# EAGLE schematic Dragon-Lamp (EAGLE 9.6.2)
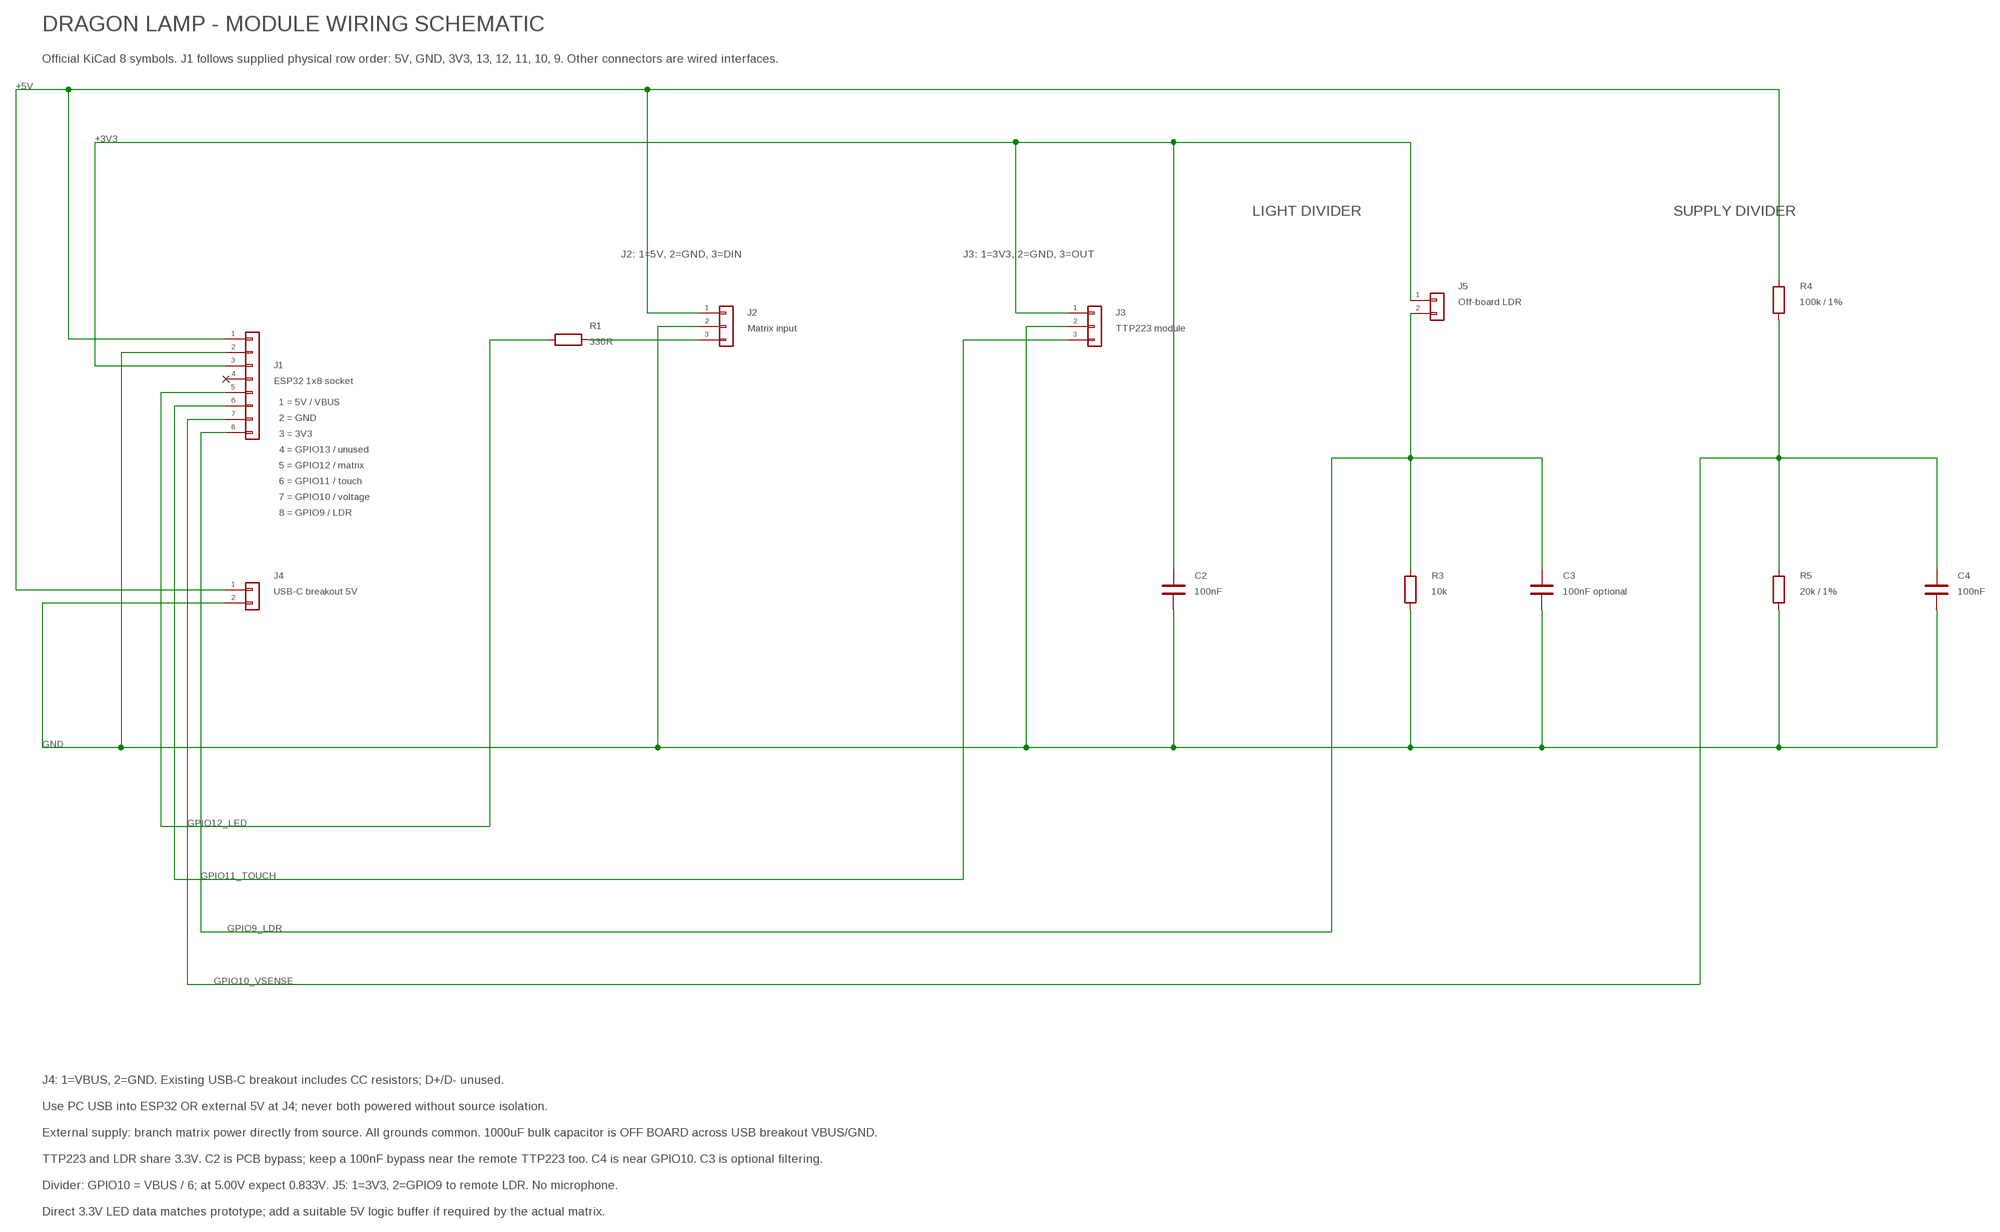
[diagram p0: schematic, sheet 1]

## Parts
C2  100nF  Device_C-THT  [C_DISC_P5.00]
C3  100nF optional  Device_C-THT  [C_DISC_P5.00]
C4  100nF  Device_C-THT  [C_DISC_P5.00]
J1  ESP32 1x8 socket  Connector_Generic_Conn_01x08-THT  [HEADER_1X8_P2.54]
J2  Matrix input  Connector_Generic_Conn_01x03-THT  [HEADER_1X3_P2.54]
J3  TTP223 module  Connector_Generic_Conn_01x03-THT  [HEADER_1X3_P2.54]
J4  USB-C breakout 5V  Connector_Generic_Conn_01x02-THT  [HEADER_1X2_P2.54]
J5  Off-board LDR  Connector_Generic_Conn_01x02-THT  [HEADER_1X2_P2.54]
R1  330R  Device_R-THT  [R_VERTICAL_P2.54]
R3  10k  Device_R-THT  [R_VERTICAL_P2.54]
R4  100k / 1%  Device_R-THT  [R_VERTICAL_P2.54]
R5  20k / 1%  Device_R-THT  [R_VERTICAL_P2.54]

## Nets
+3V3: C2.1 J1.3 J3.1 J5.1
+5V: J1.1 J2.1 J4.1 R4.1
GND: C2.2 C3.2 C4.2 J1.2 J2.2 J3.2 J4.2 R3.2 R5.2
GPIO9_LDR: C3.1 J1.8 J5.2 R3.1
GPIO10_VSENSE: C4.1 J1.7 R4.2 R5.1
GPIO11_TOUCH: J1.6 J3.3
GPIO12_LED: J1.5 R1.2
LED_DIN: J2.3 R1.1
Unconnected: J1.4

## Notes on the sheet
- DRAGON LAMP - MODULE WIRING SCHEMATIC
- Official KiCad 8 symbols. J1 follows supplied physical row order: 5V, GND, 3V3, 13, 12, 11, 10, 9. Other connectors are wired interfaces.
- LIGHT DIVIDER | SUPPLY DIVIDER
- J2: 1=5V, 2=GND, 3=DIN | J3: 1=3V3, 2=GND, 3=OUT
- 1 = 5V / VBUS
- 2 = GND
- 3 = 3V3
- 4 = GPIO13 / unused
- 5 = GPIO12 / matrix
- 6 = GPIO11 / touch
- 7 = GPIO10 / voltage
- 8 = GPIO9 / LDR
- J4: 1=VBUS, 2=GND. Existing USB-C breakout includes CC resistors; D+/D- unused.
- Use PC USB into ESP32 OR external 5V at J4; never both powered without source isolation.
- External supply: branch matrix power directly from source. All grounds common. 1000uF bulk capacitor is OFF BOARD across USB breakout VBUS/GND.
- TTP223 and LDR share 3.3V. C2 is PCB bypass; keep a 100nF bypass near the remote TTP223 too. C4 is near GPIO10. C3 is optional filtering.
- Divider: GPIO10 = VBUS / 6; at 5.00V expect 0.833V. J5: 1=3V3, 2=GPIO9 to remote LDR. No microphone.
- Direct 3.3V LED data matches prototype; add a suitable 5V logic buffer if required by the actual matrix.

## Library data of the parts
C2-C4 = Dragon_KiCad_Official:Device_C
J1 = Dragon_KiCad_Official:Connector_Generic_Conn_01x08
J2 J3 = Dragon_KiCad_Official:Connector_Generic_Conn_01x03
J4 J5 = Dragon_KiCad_Official:Connector_Generic_Conn_01x02
R1 R3-R5 = Dragon_KiCad_Official:Device_R

## Net classes
0 default: clearance 0.254 mm